# Altium schematic sheet PCB-MAIN_09_CONNECTORS_TEST.SchDoc
size 594 x 420 mm
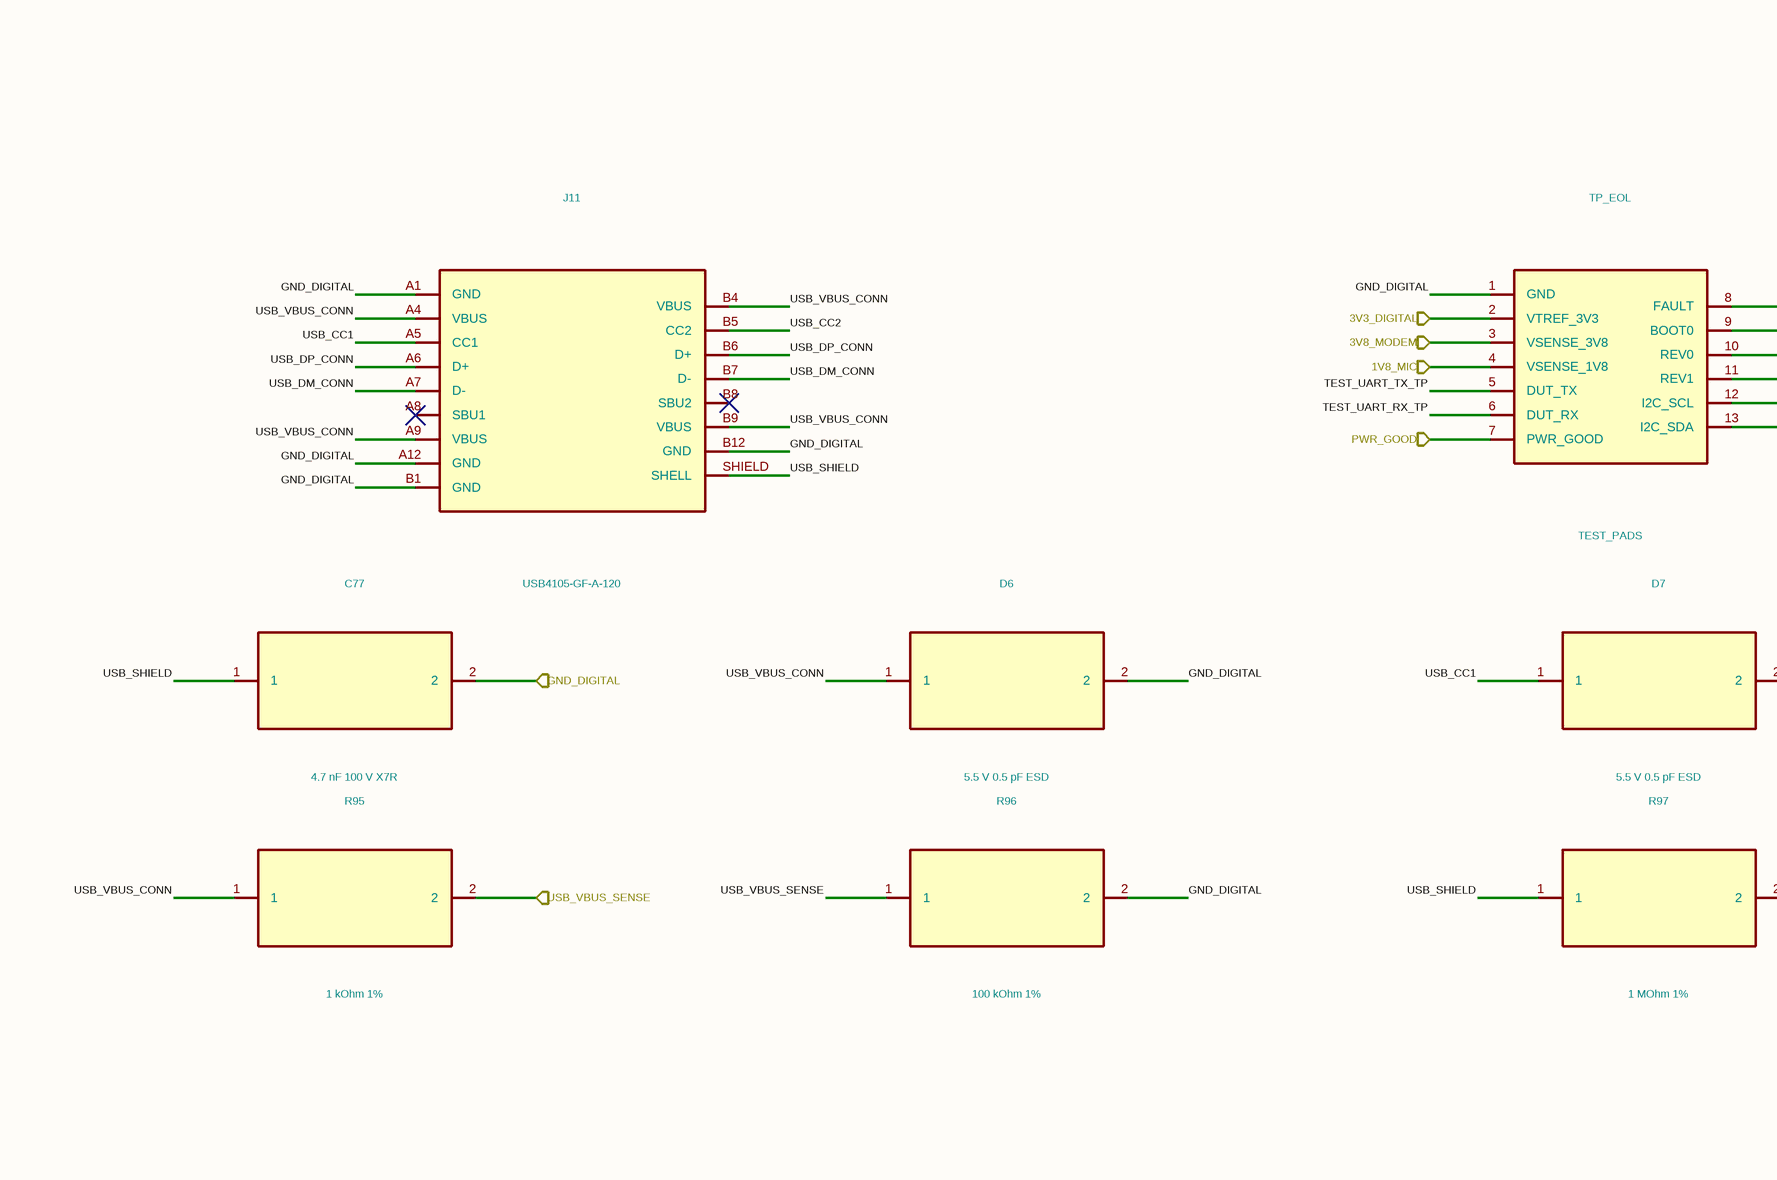
[diagram p0: PCB-MAIN_09_CONNECTORS_TEST.SchDoc, top left]
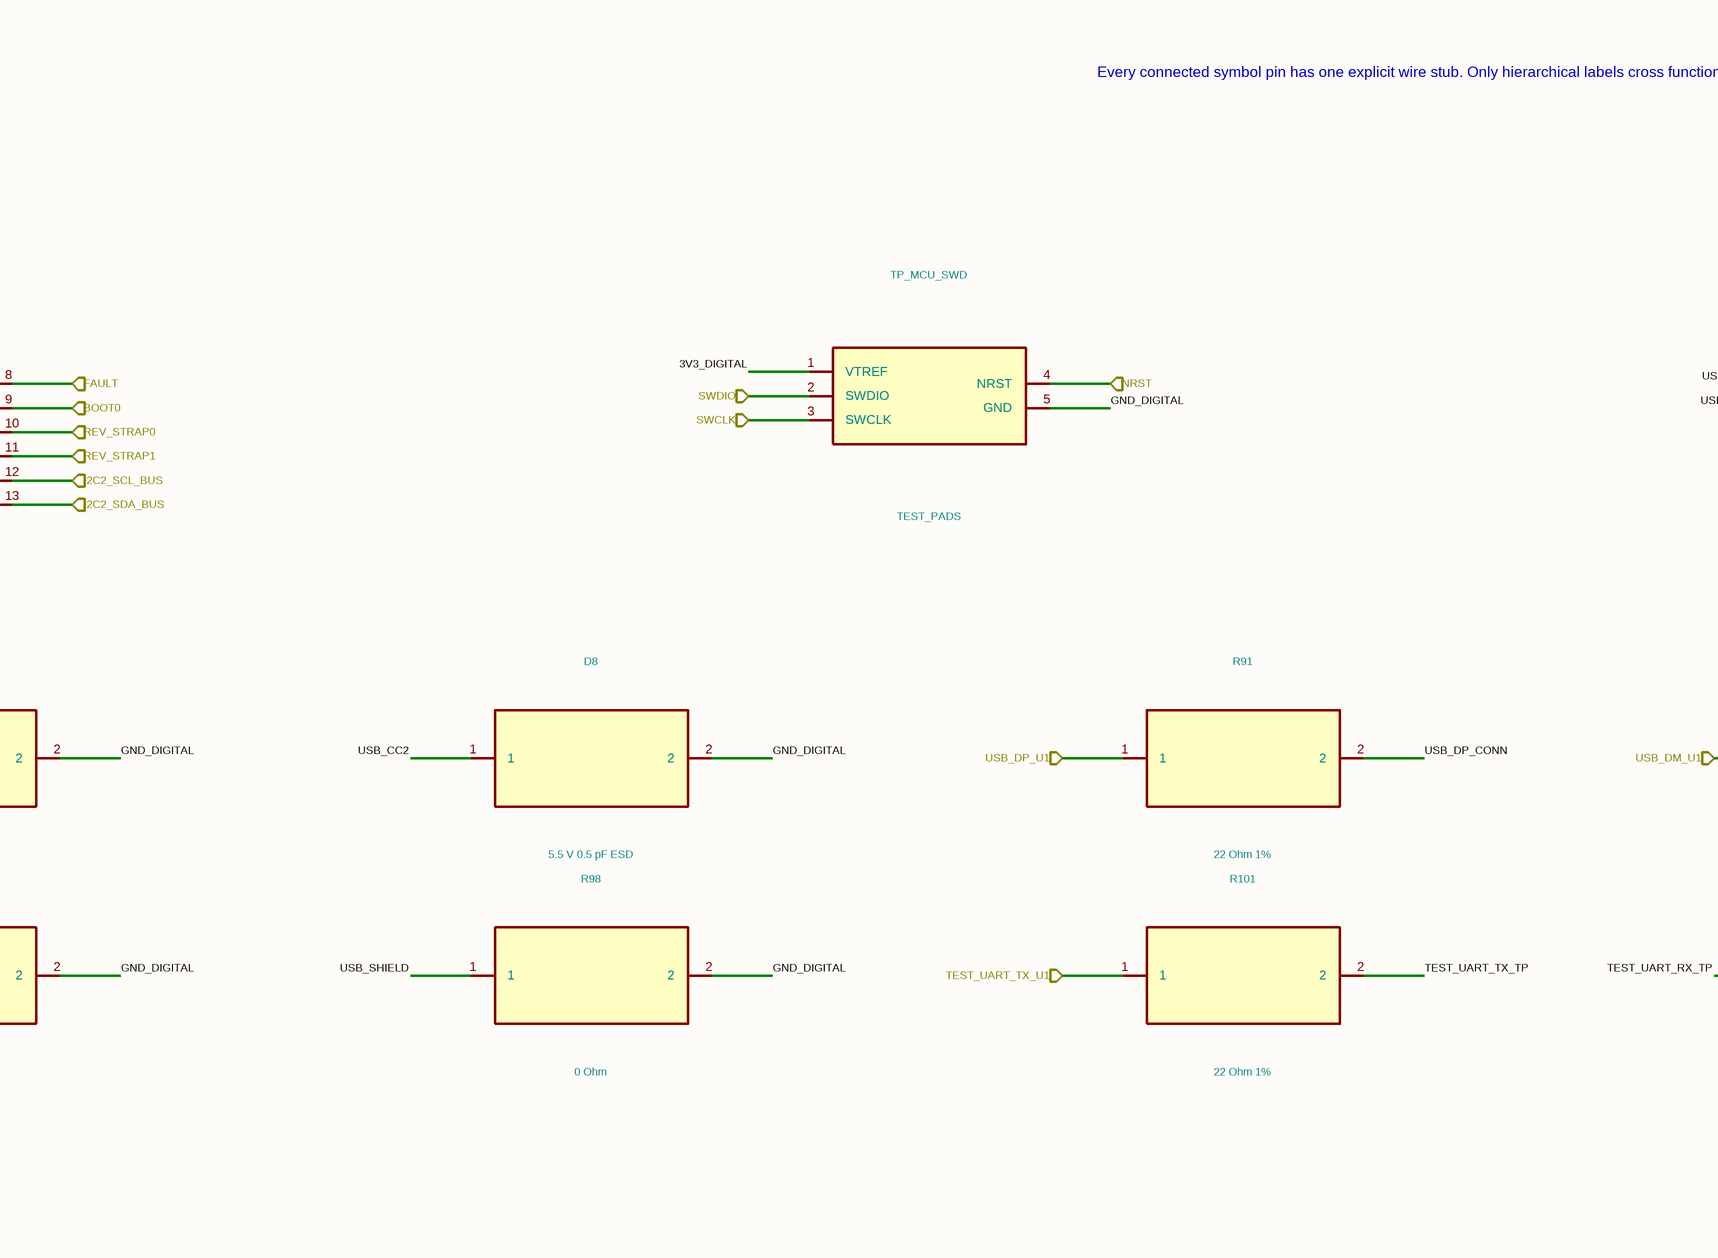
[diagram p1: PCB-MAIN_09_CONNECTORS_TEST.SchDoc, top middle]
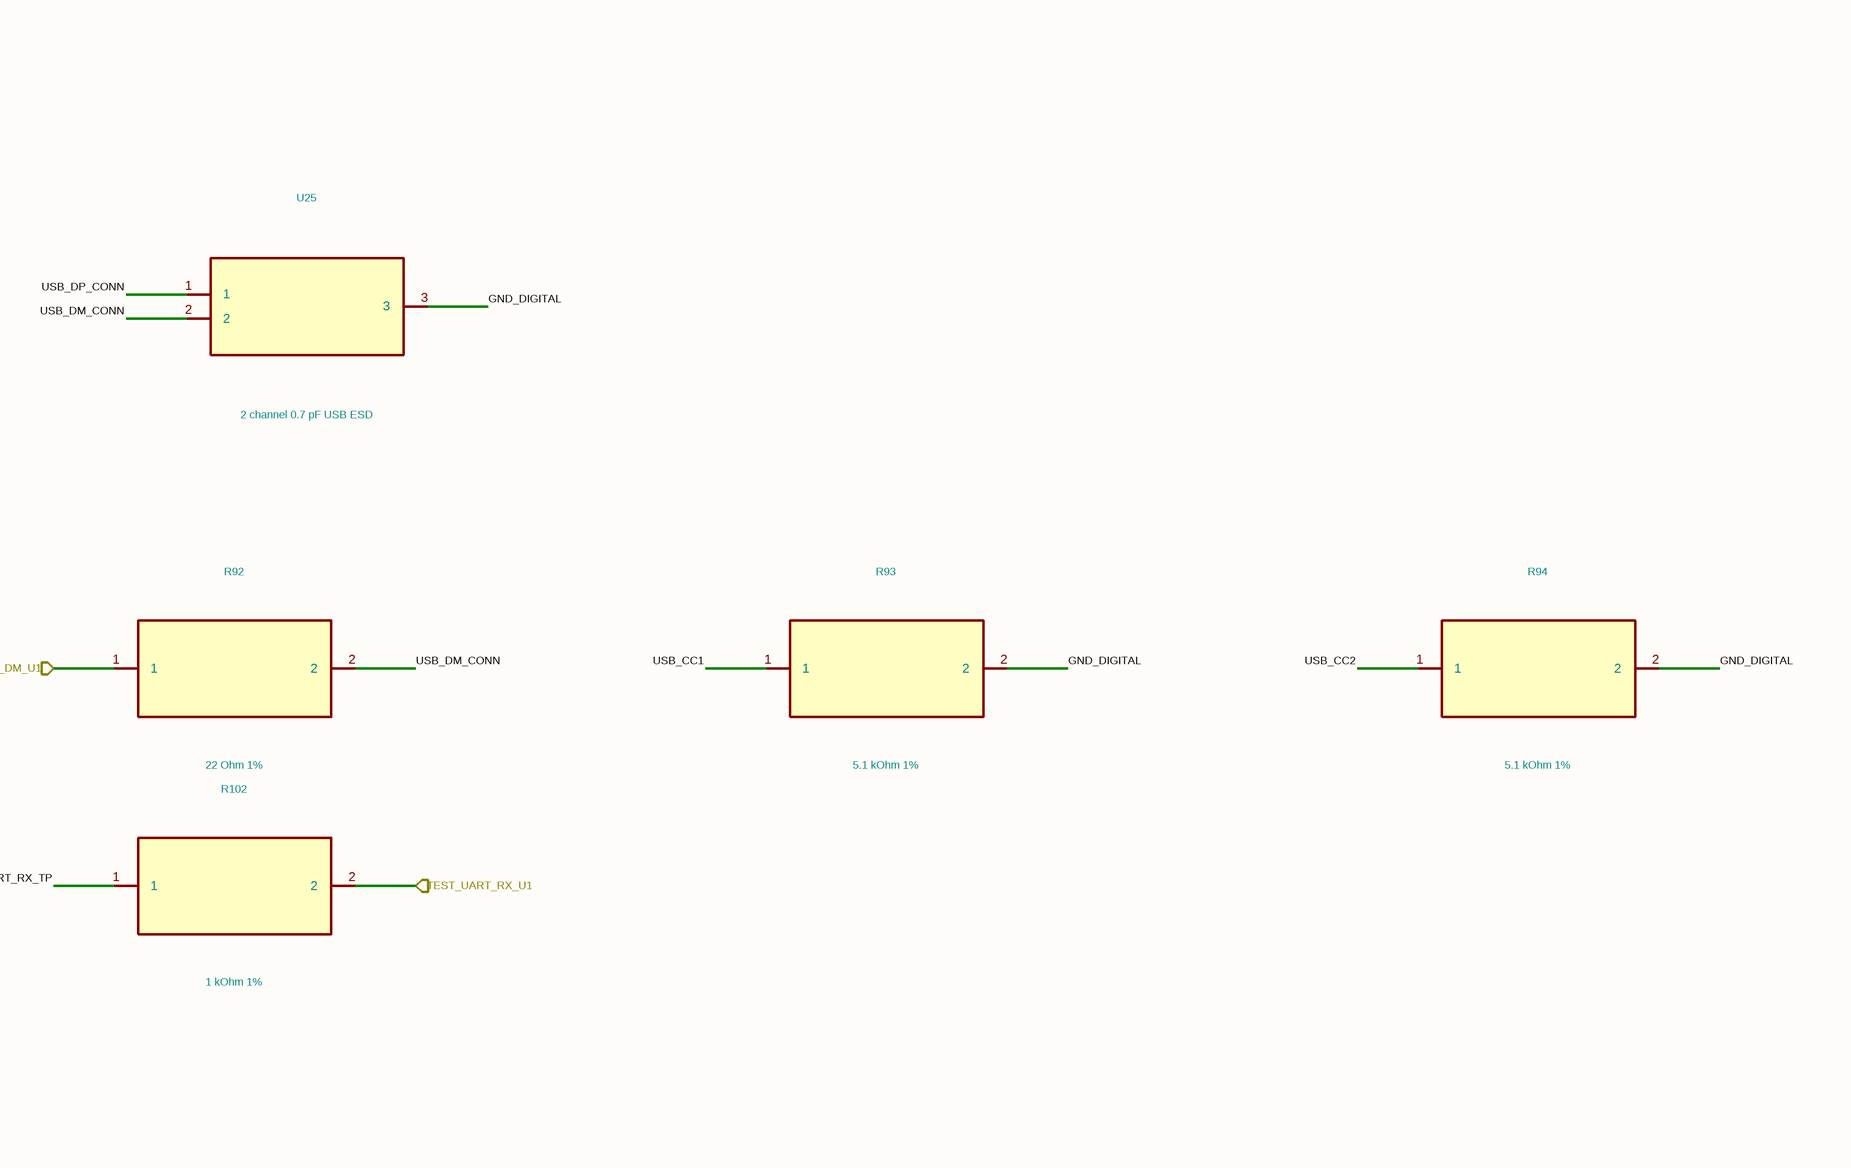
[diagram p2: PCB-MAIN_09_CONNECTORS_TEST.SchDoc, top right]
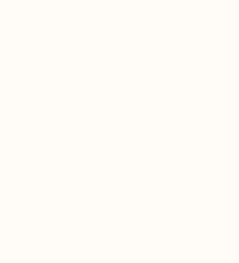
[diagram p3: PCB-MAIN_09_CONNECTORS_TEST.SchDoc, bottom left]

## Parts
C77  4.7 nF 100 V X7R  [C_0402_1005Metric]
D6  5.5 V 0.5 pF ESD
D7  5.5 V 0.5 pF ESD
D8  5.5 V 0.5 pF ESD
J11  USB4105-GF-A-120
R91  22 Ohm 1%  [R_0402_1005Metric]
R92  22 Ohm 1%  [R_0402_1005Metric]
R93  5.1 kOhm 1%  [R_0402_1005Metric]
R94  5.1 kOhm 1%  [R_0402_1005Metric]
R95  1 kOhm 1%  [R_0402_1005Metric]
R96  100 kOhm 1%  [R_0402_1005Metric]
R97  1 MOhm 1%  [R_0402_1005Metric]
R98  0 Ohm  [R_0402_1005Metric]
R101  22 Ohm 1%  [R_0402_1005Metric]
R102  1 kOhm 1%  [R_0402_1005Metric]
TP_EOL  TEST_PADS
TP_MCU_SWD  TEST_PADS
U25  2 channel 0.7 pF USB ESD

## Ports
1V8_MIC, 3V3_DIGITAL, 3V8_MODEM, BOOT0, FAULT, GND_DIGITAL, I2C2_SCL_BUS, I2C2_SDA_BUS, NRST, PWR_GOOD, REV_STRAP0, REV_STRAP1, SWCLK, SWDIO, TEST_UART_RX_U1, TEST_UART_TX_U1, USB_DM_U1, USB_DP_U1, USB_VBUS_SENSE

## Nets
1V8_MIC: TP_EOL.4(VSENSE_1V8) ; port 1V8_MIC
3V3_DIGITAL: TP_EOL.2(VTREF_3V3) ; port 3V3_DIGITAL
3V3_DIGITAL: TP_MCU_SWD.1(VTREF)  [a separate net that carries the same name]
3V8_MODEM: TP_EOL.3(VSENSE_3V8) ; port 3V8_MODEM
BOOT0: TP_EOL.9(BOOT0) ; port BOOT0
FAULT: TP_EOL.8(FAULT) ; port FAULT
GND_DIGITAL: C77.2 ; port GND_DIGITAL
GND_DIGITAL: D6.2 D7.2 D8.2 J11.A1(GND) J11.A12(GND) J11.B1(GND) J11.B12(GND) R93.2 R94.2 R96.2 R97.2 R98.2 TP_EOL.1(GND) TP_MCU_SWD.5(GND) U25.3  [a separate net that carries the same name]
I2C2_SCL_BUS: TP_EOL.12(I2C_SCL) ; port I2C2_SCL_BUS
I2C2_SDA_BUS: TP_EOL.13(I2C_SDA) ; port I2C2_SDA_BUS
NRST: TP_MCU_SWD.4(NRST) ; port NRST
PWR_GOOD: TP_EOL.7(PWR_GOOD) ; port PWR_GOOD
REV_STRAP0: TP_EOL.10(REV0) ; port REV_STRAP0
REV_STRAP1: TP_EOL.11(REV1) ; port REV_STRAP1
SWCLK: TP_MCU_SWD.3(SWCLK) ; port SWCLK
SWDIO: TP_MCU_SWD.2(SWDIO) ; port SWDIO
TEST_UART_RX_TP: R102.1 TP_EOL.6(DUT_RX)
TEST_UART_RX_U1: R102.2 ; port TEST_UART_RX_U1
TEST_UART_TX_TP: R101.2 TP_EOL.5(DUT_TX)
TEST_UART_TX_U1: R101.1 ; port TEST_UART_TX_U1
USB_CC1: D7.1 J11.A5(CC1) R93.1
USB_CC2: D8.1 J11.B5(CC2) R94.1
USB_DM_CONN: J11.A7(D-) J11.B7(D-) R92.2 U25.2
USB_DM_U1: R92.1 ; port USB_DM_U1
USB_DP_CONN: J11.A6(D+) J11.B6(D+) R91.2 U25.1
USB_DP_U1: R91.1 ; port USB_DP_U1
USB_SHIELD: C77.1 J11.SHIELD(SHELL) R97.1 R98.1
USB_VBUS_CONN: D6.1 J11.A4(VBUS) J11.A9(VBUS) J11.B4(VBUS) J11.B9(VBUS) R95.1
USB_VBUS_SENSE: R95.2 ; port USB_VBUS_SENSE
USB_VBUS_SENSE: R96.1  [a separate net that carries the same name]

Not connected (* = marked no-connect by the designer): J11 A8(SBU1)* B8(SBU2)*

## Notes on the sheet
- Every connected symbol pin has one explicit wire stub. Only hierarchical labels cross functional-sheet boundaries.
- 1
- 2
- 3
- 4
- 5
- 6
- 7
- 8
- 9
- 10
- 11
- A
- B
- C
- D
- E
- F
- G
- H
- Human-readable hierarchy candidate; exact Review-A pin/net equivalence enforced
- Functional sheet 10 of 10
- NOT FOR MANUFACTURE - hierarchy review/routing/DRC/DFM/Review B pending
- Title: Dioneya PCB-MAIN Rev.A - USB + debug
- File: PCB-MAIN_09_CONNECTORS_TEST.kicad_sch
- Sheet: /
- Dioneya / ZS-BPLA
- KiCad E.D.A.  kicad (5.1.4)-1
- Size: A2
- Date: 2026-09-16
- Rev: A
- Id: 1/1

## Library data of the parts
C77 = C77_GRM155R72A472KA01D: Manufacturer: Murata; Population: FITTED; Authority: PROJECT_EMC_BASELINE; MPN: GRM155R72A472KA01D; Package: 0402; Value: 4.7 nF 100 V X7R; Footprint: Capacitor_SMD:C_0402_1005Metric
D6 = D6_TPD1E05U06DYAR: Manufacturer: Texas Instruments; Population: FITTED; Authority: TI_TPDxE05U06_RevO; MPN: TPD1E05U06DYAR; Package: SOD-523_DYA; Value: 5.5 V 0.5 pF ESD
D7 = D7_TPD1E05U06DYAR: Manufacturer: Texas Instruments; Population: FITTED; Authority: TI_TPDxE05U06_RevO; MPN: TPD1E05U06DYAR; Package: SOD-523_DYA; Value: 5.5 V 0.5 pF ESD
D8 = D8_TPD1E05U06DYAR: Manufacturer: Texas Instruments; Population: FITTED; Authority: TI_TPDxE05U06_RevO; MPN: TPD1E05U06DYAR; Package: SOD-523_DYA; Value: 5.5 V 0.5 pF ESD
J11 = J11_USB4105-GF-A-120: Manufacturer: CONTROLLED_AUTHORITY; Population: FITTED; Authority: PCB_MAIN_CONNECTOR_FIXTURE_PIN_AUTHORITY_REV_A.csv; MPN: USB4105-GF-A-120; Package: USB-C_16P_horizontal_top_mount_1.20mm_stake; Value: USB4105-GF-A-120
R91 = R91_ERJ-2RKF22R0X: Manufacturer: Panasonic; Population: FITTED; Authority: ST_STM32U585_DS13086_Rev10; MPN: ERJ-2RKF22R0X; Package: 0402; Value: 22 Ohm 1%; Footprint: Resistor_SMD:R_0402_1005Metric
R92 = R92_ERJ-2RKF22R0X: Manufacturer: Panasonic; Population: FITTED; Authority: ST_STM32U585_DS13086_Rev10; MPN: ERJ-2RKF22R0X; Package: 0402; Value: 22 Ohm 1%; Footprint: Resistor_SMD:R_0402_1005Metric
R93 = R93_ERJ-2RKF5101X: Manufacturer: Panasonic; Population: FITTED; Authority: USB_Type-C_Release_2.5; MPN: ERJ-2RKF5101X; Package: 0402; Value: 5.1 kOhm 1%; Footprint: Resistor_SMD:R_0402_1005Metric
R94 = R94_ERJ-2RKF5101X: Manufacturer: Panasonic; Population: FITTED; Authority: USB_Type-C_Release_2.5; MPN: ERJ-2RKF5101X; Package: 0402; Value: 5.1 kOhm 1%; Footprint: Resistor_SMD:R_0402_1005Metric
R95 = R95_ERJ-2RKF1001X: Manufacturer: Panasonic; Population: FITTED; Authority: ST_STM32U585_DS13086_Rev10; MPN: ERJ-2RKF1001X; Package: 0402; Value: 1 kOhm 1%; Footprint: Resistor_SMD:R_0402_1005Metric
R96 = R96_ERJ-2RKF1003X: Manufacturer: Panasonic; Population: FITTED; Authority: PROJECT_MAIN_AUTH_010; MPN: ERJ-2RKF1003X; Package: 0402; Value: 100 kOhm 1%; Footprint: Resistor_SMD:R_0402_1005Metric
R97 = R97_ERJ-2RKF1004X: Manufacturer: Panasonic; Population: FITTED; Authority: PROJECT_EMC_BASELINE; MPN: ERJ-2RKF1004X; Package: 0402; Value: 1 MOhm 1%; Footprint: Resistor_SMD:R_0402_1005Metric
R98 = R98_ERJ-2GE0R00X: Manufacturer: Panasonic; Population: DNP; Authority: PROJECT_EMC_BASELINE; MPN: ERJ-2GE0R00X; Package: 0402; Value: 0 Ohm; Footprint: Resistor_SMD:R_0402_1005Metric
R101 = R101_ERJ-2RKF22R0X: Manufacturer: Panasonic; Population: FITTED; Authority: PROJECT_EOL_DFT; MPN: ERJ-2RKF22R0X; Package: 0402; Value: 22 Ohm 1%; Footprint: Resistor_SMD:R_0402_1005Metric
R102 = R102_ERJ-2RKF1001X: Manufacturer: Panasonic; Population: FITTED; Authority: PROJECT_EOL_DFT; MPN: ERJ-2RKF1001X; Package: 0402; Value: 1 kOhm 1%; Footprint: Resistor_SMD:R_0402_1005Metric
TP_EOL = TP_EOL_TEST_PADS: Manufacturer: CONTROLLED_AUTHORITY; Population: FITTED; Authority: PCB_MAIN_CONNECTOR_FIXTURE_PIN_AUTHORITY_REV_A.csv; MPN: TEST_PADS; Package: POGO_FIXTURE_13P; Value: TEST_PADS
TP_MCU_SWD = TP_MCU_SWD_TEST_PADS: Manufacturer: CONTROLLED_AUTHORITY; Population: FITTED; Authority: PCB_MAIN_CONNECTOR_FIXTURE_PIN_AUTHORITY_REV_A.csv; MPN: TEST_PADS; Package: POGO_FIXTURE_5P; Value: TEST_PADS
U25 = U25_TPD2EUSB30DRTR: Manufacturer: Texas Instruments; Population: FITTED; Authority: TI_TPD2EUSB30_datasheet; MPN: TPD2EUSB30DRTR; Package: SOT-9X3_DRT; Value: 2 channel 0.7 pF USB ESD